# Altium schematic sheet Wide-Band.SchDoc
size A4; SheetNumber: 4; SheetTotal: 5
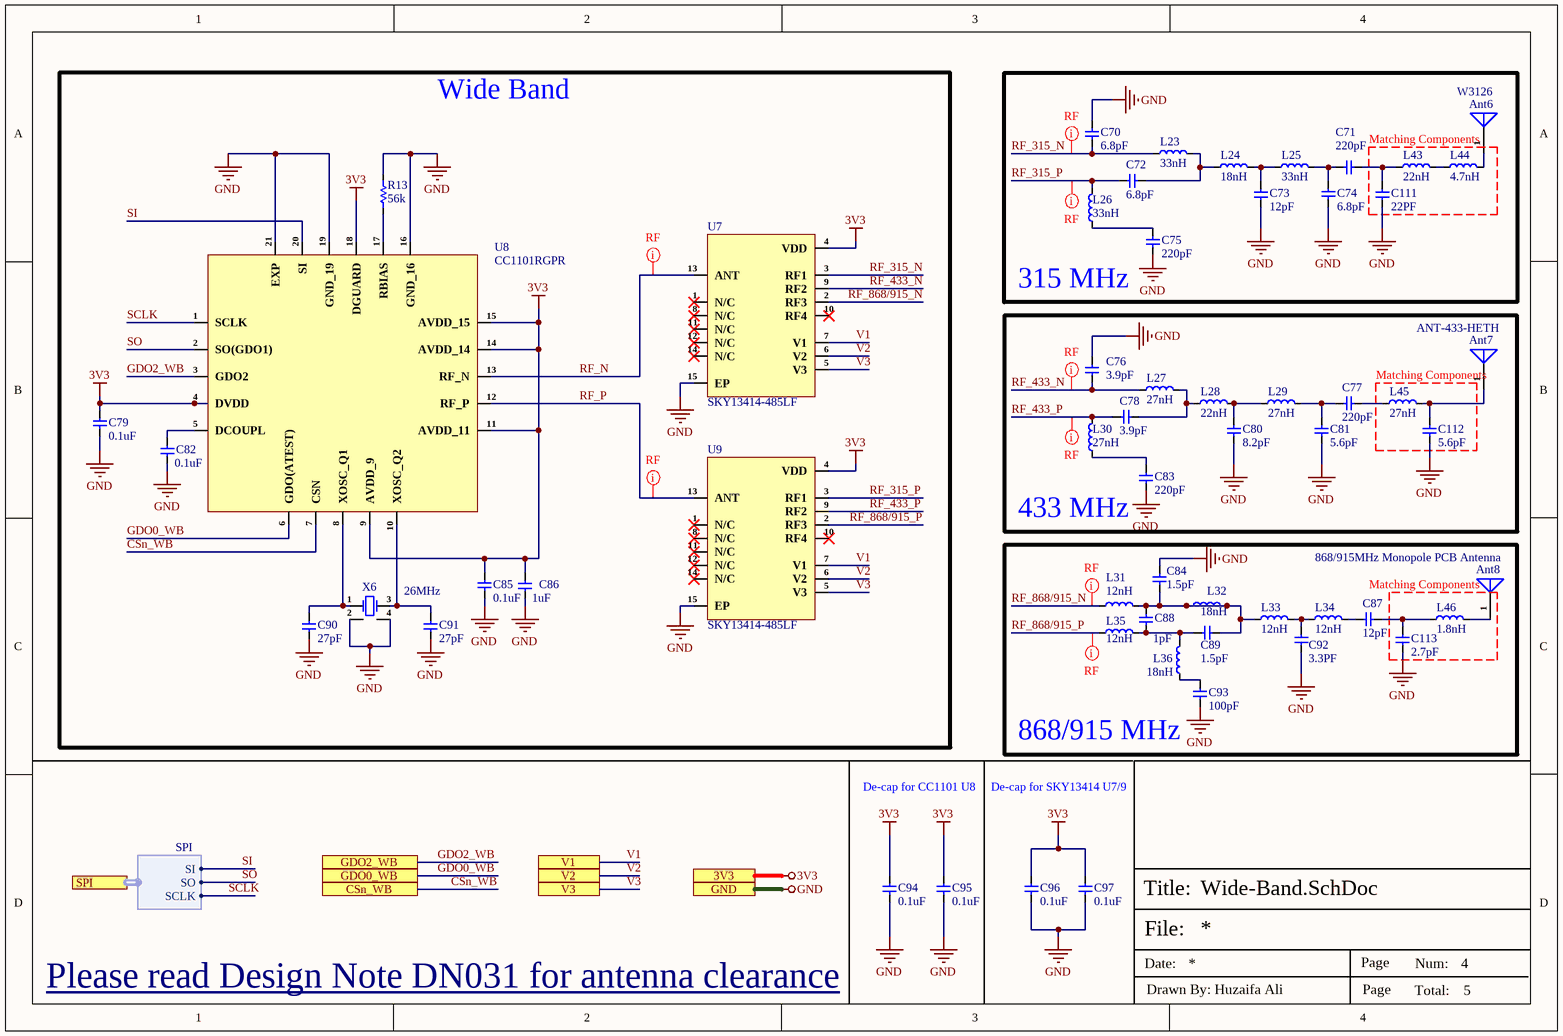
[diagram p0: Wide-Band.SchDoc]

## Parts
Ant6  W3126  [W3126]
Ant7  ANT-433-HETH  [ANT-433-HETH]
Ant8  868/915MHz Monopole PCB Antenna  [868/915MHz Monopole PCB Antenna]
C70  6.8pF  [Cap-0402]
C71  220pF  [Cap-0402]
C72  6.8pF  [Cap-0402]
C73  12pF  [Cap-0402]
C74  6.8pF  [Cap-0402]
C75  220pF  [Cap-0402]
C76  3.9pF  [Cap-0402]
C77  220pF  [Cap-0402]
C78  3.9pF  [Cap-0402]
C79  0.1uF  [Cap-0402]
C80  8.2pF  [Cap-0402]
C81  5.6pF  [Cap-0402]
C82  0.1uF  [Cap-0402]
C83  220pF  [Cap-0402]
C84  1.5pF  [Cap-0402]
C85  0.1uF  [Cap-0402]
C86  1uF  [Cap-0402]
C87  12pF  [Cap-0402]
C88  1pF  [Cap-0402]
C89  1.5pF  [Cap-0402]
C90  27pF  [Cap-0402]
C91  27pF  [Cap-0402]
C92  3.3PF  [Cap-0402]
C93  100pF  [Cap-0402]
C94  0.1uF  [Cap-0402]
C95  0.1uF  [Cap-0402]
C96  0.1uF  [Cap-0402]
C97  0.1uF  [Cap-0402]
C111  22PF  [Cap-0402]
C112  5.6pF  [Cap-0402]
C113  2.7pF  [CAP-0201]
L23  33nH  [IND-0402]
L24  18nH  [IND-0402]
L25  33nH  [IND-0402]
L26  33nH  [IND-0402]
L27  27nH  [IND-0402]
L28  22nH  [IND-0402]
L29  27nH  [IND-0402]
L30  27nH  [IND-0402]
L31  12nH  [IND-0402]
L32  18nH  [IND-0402]
L33  12nH  [IND-0402]
L34  12nH  [IND-0402]
L35  12nH  [IND-0402]
L36  18nH  [IND-0402]
L43  22nH  [IND-0402]
L44  4.7nH  [IND-0402]
L45  27nH  [IND-0402]
L46  1.8nH  [IND-0402]
R13  56k  [Res-0402]
U7  SKY13414-485LF  [14-QFN (2x2)]
U8  CC1101RGPR  [20-QFN (4x4)]
U9  SKY13414-485LF  [14-QFN (2x2)]
X6  26MHz  [NX3225GA-26MHZ-EXS00A-CG01972]

## Blocks framed on the sheet
Wide Band: C79 C82 C85 C86 C90 C91 R13 U7-U9 X6
315 MHz: Ant6 C70-C75 L23-L26
Matching Components: C111 L43 L44
433 MHz: Ant7 C76-C78 C80 C81 C83 L27-L30
Matching Components: C112 L45
868/915 MHz: Ant8 C84 C87-C89 C92 C93 C113 L31-L36 L46

## Ports
3V3 (see Top-Sheet[3B], CC1101[2D], Controller-Sheet[2D], Power-Sheet[1D]), CSn_WB (see Top-Sheet[3B], Controller-Sheet[2D]), GDO0_WB (see Top-Sheet[3B], Controller-Sheet[2D]), GDO2_WB (see Top-Sheet[3B], Controller-Sheet[2D]), GND (see Top-Sheet[3B], CC1101[2D], Controller-Sheet[2D], Power-Sheet[1D]), SPI (harness SPI, see Top-Sheet[3B], CC1101[2D], Controller-Sheet[3D]), V1 (see Top-Sheet[3B], Controller-Sheet[2D]), V2 (see Top-Sheet[3B], Controller-Sheet[2D]), V3 (see Top-Sheet[3B], Controller-Sheet[2D])

## Harnesses
SPI: SI, SO, SCLK

## Nets
3V3: C79.1 C85.1 C86.2 C94.1 C95.1 C96.1 C97.1 U7.4(VDD) U8.4(DVDD) U8.9(AVDD_9) U8.11(AVDD_11) U8.14(AVDD_14) U8.15(AVDD_15) U8.18(DGUARD) U9.4(VDD) ; port 3V3
GND: C70.2 C73.1 C74.2 C75.1 C76.2 C79.2 C80.1 C81.1 C82.1 C83.1 C84.2 C85.2 C86.1 C90.1 C91.1 C92.1 C93.1 C94.2 C95.2 C96.2 C97.2 C111.1 C112.1 C113.1 R13.2 U7.15(EP) U8.16(GND_16) U8.19(GND_19) U8.21(EXP) U9.15(EP) X6.2(GND) X6.4(GND) ; port GND
CSn_WB: U8.7(CSN) ; port CSn_WB
GDO0_WB: U8.6(GDO(ATEST)) ; port GDO0_WB
GDO2_WB: U8.3(GDO2) ; port GDO2_WB
RF_315_N: C70.1 L23.1 U7.3(RF1)
RF_315_P: C72.1 L26.2 U9.3(RF1)
RF_433_N: C76.1 L27.1 U7.9(RF2)
RF_433_P: C78.2 L30.2 U9.9(RF2)
RF_868/915_N: L31.1 U7.2(RF3)
RF_868/915_P: L35.1 U9.2(RF3)
RF_N: U7.13(ANT) U8.13(RF_N)
RF_P: U8.12(RF_P) U9.13(ANT)
SCLK: U8.1(SCLK) ; port SPI.SCLK
SI: U8.20(SI) ; port SPI.SI
SO: U8.2(SO(GDO1)) ; port SPI.SO
V1: U7.7(V1) U9.7(V1) ; port V1
V2: U7.6(V2) U9.6(V2) ; port V2
V3: U7.5(V3) U9.5(V3) ; port V3
NetAnt6_1: Ant6.1(FEED) L44.2
NetAnt7_1: Ant7.1(FEED) C112.2 L45.2
NetAnt8_1: Ant8.1(FEED) L46.2
NetC71_1: C71.1 C111.2 L43.1
NetC71_2: C71.2 C74.1 L25.2
NetC72_2: C72.2 L23.2 L24.1
NetC73_2: C73.2 L24.2 L25.1
NetC75_2: C75.2 L26.1
NetC77_1: C77.1 L45.1
NetC77_2: C77.2 C81.2 L29.2
NetC78_1: C78.1 L27.2 L28.1
NetC80_2: C80.2 L28.2 L29.1
NetC82_2: C82.2 U8.5(DCOUPL)
NetC83_2: C83.2 L30.1
NetC84_1: C84.1 C88.2 C89.1 L31.2 L32.1 L32.2 L33.1
NetC87_1: C87.1 L34.2
NetC87_2: C87.2 C113.2 L46.1
NetC88_1: C88.1 C89.2 L35.2 L36.2
NetC90_2: C90.2 U8.8(XOSC_Q1) X6.1(OSC1)
NetC91_2: C91.2 U8.10(XOSC_Q2) X6.3(OSC2)
NetC92_2: C92.2 L33.2 L34.1
NetC93_2: C93.2 L36.1
NetL43_2: L43.2 L44.1
NetR13_1: R13.1 U8.17(RBIAS)

Not connected (* = marked no-connect by the designer): U7 1(N/C)* 8(N/C)* 10(RF4)* 11(N/C)* 12(N/C)* 14(N/C)*; U9 1(N/C)* 8(N/C)* 10(RF4)* 11(N/C)* 12(N/C)* 14(N/C)*

## Layout directives
net class RF: RF_315_N, RF_315_P, RF_433_N, RF_433_P, RF_868/915_N, RF_868/915_P, RF_N, RF_P

## Notes on the sheet
- (near Ant8) Matching Components
- De-cap for CC1101 U8
- De-cap for SKY13414 U7/9
- Please read Design Note DN031 for antenna clearance <https://www.ti.com/lit/an/swra328/swra328.pdf?ts=1705904691680>
- File:
- Title:
- Date:
- Page
- Num:
- Total:
- Drawn By: Huzaifa Ali

## Library data of the parts
Ant6 = W3126: RF ANT 315MHZ HELICAL SOLDER SMD; Manufacturer: Pulse; Impedance: 50R; Number of Bands: 1; Return Loss: -10dB; Gain: -5dB; VSWR: 1.9; Item Type: Antenna; Supplier: Mouser; Supplier Part Number: 673-W3126; Manufacturer Part Number: W3126; RoHS: Yes; Category: RF Antennas; Stock: 256; Pricing: 1=1.73, 10=1.55, 50=1.55, 100=1.25, 1000=0.852, 10000=0.735 (USD); Mounting Technology: Surface Mount,Through Hole,PCB; Packaging: Tray; Series: -; Package Quantity: 1600; Termination: Solder; Frequency: 315MHz; Height: 0.276inch; Radiation Hardening: No; ComponentLink1URL: https://datasheet.ciiva.com/8153/+w3126-8153071.pdf?src-supplier=Avnet; ComponentLink1Description: https://datasheet.ciiva.com/8153/+w3126-8153071.pdf?src-supplier=Avnet; ComponentLink2URL: https://datasheet.ciiva.com/2792/+w3126-2792620.pdf?src-supplier=Digikey; ComponentLink2Description: https://datasheet.ciiva.com/2792/+w3126-2792620.pdf?src-supplier=Digikey
Ant7 = ANT-433-HETH: RF ANT 433MHZ HELICAL SLD TH; Manufacturer: TE Connectivity; Item Type: Antenna; Manufacturer Part Number: ANT-433-HETH; Package: Custom
Ant8 = 868/915MHz Monopole PCB Antenna: Monopole PCB Antenna with Single or Dual Band Option; Manufacturer Part Number: 868/915MHz Monopole PCB Antenna; Item Type: Antenna; ComponentLink1Description: Anttena; ComponentLink1URL: https://www.ti.com/lit/an/swra227e/swra227e.pdf?ts=1705864571951
C70 C72 C74 = CC0402CRNPO9BN6R8: CAP CER 6.8PF 50V C0G/NPO 0402; Manufacturer: Yageo; Dielectric: C0G; Tolerance: 2%; Insulation Resistance: 10GR; Item Type: Capacitor; Supplier: Future Electronics; Supplier Part Number: 3247368; Manufacturer Part Number: CC0402CRNPO9BN6R8; RoHS: Yes; Category: Ceramic Capacitors; Stock: 200000; Pricing: 10000=0.0024, 40000=0.0022, 150000=0.0021, 400000=0.002, 1000000=0.0019 (USD); Mounting Technology: Surface Mount; Case/Package: 0402; Case Code (Imperial): 0402; Case Code (Metric): 1005; Weight: 2.3E-05oz; Min Operating Temperature: -55°C; Max Operating Temperature: 125°C; Value: 6.8pF; Packaging: Tape and Reel; Voltage Rating: 50V; Voltage Rating (DC): 50V; Termination: SMD/SMT; Series: CC; Construction: Flat; Length: 1mm; Width: 0.5mm; Height: 0.5mm; Depth: 0.5mm; Radiation Hardening: No; RoHS Compliant: Yes; ComponentLink1URL: https://datasheet.ciiva.com/11587/upy-gp-np0-16v-to-50v-8-11587182.pdf?src-supplier=Avnet; ComponentLink1Description: https://datasheet.ciiva.com/11587/upy-gp-np0-16v-to-50v-8-11587182.pdf?src-supplier=Avnet; LCSC Part Number: C189470
C71 C75 C77 C83 = CC0402JRNPO9BN221: CAP CER 220PF 50V C0G/NPO 0402; Manufacturer: Yageo; Dielectric Material: Ceramic; Tolerance: 10%; Dielectric: C0G; Temperature Coefficient: 30ppm/°C; Insulation Resistance: 10GR; Dissipation Factor: 0.1%; Supplier 1: RSComponents; Manufacturer Part Number: CC0402JRNPO9BN221; RoHS: Yes; Category: Ceramic Capacitors; Stock 1: 20000; Pricing 1: 10000=0.00600, 100000=0.00600 (GBP); Mount: Surface Mount; Case/Package: 0402; Number of Pins: 2; Case Code (Metric): 1005; Case Code (Imperial): 0402; Min Operating Temperature: -55°C; Max Operating Temperature: 125°C; Capacitance: 220pF; Package Quantity: 1; Voltage Rating: 50V; Packaging: Tape and Reel; Termination: SMD/SMT; Voltage: 50V; Series: CC; Length: 1mm; Width: 0.02inch; Height: 0.5mm; Thickness: 0.022inch; Depth: 0.5mm; Radiation Hardening: No; RoHS Compliant: Yes; REACH SVHC: No SVHC; Lead Free: Lead Free; ComponentLink1URL: https://datasheet.ciiva.com/11786/0900766b8079c870-11786154.pdf?src-supplier=RSComponents; ComponentLink1Description: https://datasheet.ciiva.com/11786/0900766b8079c870-11786154.pdf?src-supplier=RSComponents; ComponentLink2URL: https://datasheet.ciiva.com/7656/1132289-7656616.pdf?src-supplier=Element14; ComponentLink2Description: https://datasheet.ciiva.com/7656/1132289-7656616.pdf?src-supplier=Element14; ComponentLink3URL: https://datasheet.ciiva.com/8033/1443161-8033609.pdf?src-supplier=Element14; ComponentLink3Description: https://datasheet.ciiva.com/8033/1443161-8033609.pdf?src-supplier=Element14; ComponentLink4URL: https://datasheet.ciiva.com/8033/1443161-8033608.pdf?src-supplier=Element14; ComponentLink4Description: https://datasheet.ciiva.com/8033/1443161-8033608.pdf?src-supplier=Element14; ComponentLink5URL: https://datasheet.ciiva.com/176/mlccorderingcode-176384.pdf?src-supplier=Digi-Key; ComponentLink5Description: https://datasheet.ciiva.com/176/mlccorderingcode-176384.pdf?src-supplier=Digi-Key; ComponentLink6URL: https://datasheet.ciiva.com/176/mlccorderingcode-176383.pdf?src-supplier=Digi-Key; ComponentLink6Description: https://datasheet.ciiva.com/176/mlccorderingcode-176383.pdf?src-supplier=Digi-Key; ComponentLink7URL: https://datasheet.ciiva.com/176/mlccorderingcode-176385.pdf?src-supplier=Digi-Key; ComponentLink7Description: https://datasheet.ciiva.com/176/mlccorderingcode-176385.pdf?src-supplier=Digi-Key; ComponentLink8URL: https://datasheet.ciiva.com/17434/upy-gp-np0-16v-to-50v-8-17434343.pdf?src-supplier=Avnet+Europe; ComponentLink8Description: https://datasheet.ciiva.com/17434/upy-gp-np0-16v-to-50v-8-17434343.pdf?src-supplier=Avnet+Europe; Supplier Part Number 1: 6169284; LCSC Part Number: C107001
C73 C87 = GJM1555C1H120GB01D: CAP CER 12PF 50V C0G/NP0 0402; Manufacturer: Murata; Tolerance: 2%; Dielectric: C0G; Supplier 1: Digi-Key; Manufacturer Part Number: GJM1555C1H120GB01D; RoHS: Yes; Category: Ceramic Capacitors; Stock 1: 266975; Pricing 1: 1=0.18000, 10=0.12600, 50=0.07560, 100=0.06390, 500=0.04370, 1000=0.03865, 2500=0.03698, 5000=0.03361 (USD); Mount: Surface Mount; Case/Package: 0402; Case Code (Imperial): 0402; Case Code (Metric): 1005; Min Operating Temperature: -55°C; Max Operating Temperature: 125°C; Capacitance: 12pF; Voltage Rating: 50V; Voltage Rating (DC): 50V; Packaging: Tape and Reel; Package Quantity: 10000; Termination: SMD/SMT; Series: GJM; Construction: Flat; Length: 1mm; Width: 0.5mm; Height: 0.5mm; Thickness: 0.022inch; Depth: 0.5mm; Radiation Hardening: No; Lead Free: Lead Free; RoHS Compliant: Yes; ComponentLink1URL: https://datasheet.ciiva.com/11608/product-11608208.pdf?src-supplier=Avnet; ComponentLink1Description: https://datasheet.ciiva.com/11608/product-11608208.pdf?src-supplier=Avnet; ComponentLink2URL: https://datasheet.ciiva.com/29542/partnumbering-e-01-29542716.pdf?src-supplier=Digi-Key; ComponentLink2Description: https://datasheet.ciiva.com/29542/partnumbering-e-01-29542716.pdf?src-supplier=Digi-Key; ComponentLink3URL: https://datasheet.ciiva.com/29542/partnumbering-e-01-29542715.pdf?src-supplier=Digi-Key; ComponentLink3Description: https://datasheet.ciiva.com/29542/partnumbering-e-01-29542715.pdf?src-supplier=Digi-Key; ComponentLink4URL: https://datasheet.ciiva.com/29542/partnumbering-e-01-29542717.pdf?src-supplier=Digi-Key; ComponentLink4Description: https://datasheet.ciiva.com/29542/partnumbering-e-01-29542717.pdf?src-supplier=Digi-Key; Supplier Part Number 1: 490-8078-1-ND; LCSC Part Number: C161305
C76 C78 = CC0402BRNPO9BN3R9: CAP CER 3.9PF 50V C0G/NPO 0402; Manufacturer: Yageo; Item Type: Capacitor; Supplier: Future Electronics; Supplier Part Number: 4917324; Manufacturer Part Number: CC0402BRNPO9BN3R9; RoHS: Yes; Category: Ceramic Capacitors; Stock: 280000; Pricing: 10000=0.0034, 40000=0.0032, 150000=0.0031, 250000=0.003, 500000=0.0028 (USD); ComponentLink1URL: https://datasheet.ciiva.com/11587/upy-gp-np0-16v-to-50v-8-11587133.pdf?src-supplier=Avnet; ComponentLink1Description: https://datasheet.ciiva.com/11587/upy-gp-np0-16v-to-50v-8-11587133.pdf?src-supplier=Avnet; ComponentLink2URL: https://datasheet.ciiva.com/13211/upy-gp-np0-16v-to-50v-8-13211126.pdf?src-supplier=Mouser; ComponentLink2Description: https://datasheet.ciiva.com/13211/upy-gp-np0-16v-to-50v-8-13211126.pdf?src-supplier=Mouser; LCSC Part Number: C505474
C79 C85 C94-C97 = C1005X5R1H104K050BB: CAP CER 0.1UF 50V X5R 0402; Manufacturer: TDK; Dielectric Material: Ceramic; Capacitance: 100nF; Tolerance: 10%; Supplier 1: Digi-Key; Manufacturer Part Number: C1005X5R1H104K050BB; Stock 1: 1455182; Pricing 1: 1=0.12, 10=0.09, 50=0.049, 100=0.04, 500=0.02858, 1000=0.02245, 2500=0.02041, 5000=0.01878 (USD); Mount: Surface Mount; Case/Package: 0402; Case Code (Metric): 1005; Case Code (Imperial): 0402; Weight: 2.3E-05oz; Min Operating Temperature: -55°C; Max Operating Temperature: 85°C; Dielectric: X5R; Voltage Rating: 50V; Packaging: Tape and Reel; Voltage Rating (DC): 50V; Termination: SMD/SMT; Construction: Flat; Package Quantity: 1; Resistor Type: Ceramic; Voltage: 50V; Series: C; Length: 1mm; Width: 0.02inch; Height: 0.5mm; Depth: 0.5mm; Thickness: 0.022inch; Radiation Hardening: No; Lead Free: Lead Free; REACH SVHC: No SVHC; RoHS Compliant: Yes; ComponentLink1URL: https://product.tdk.com/info/en/catalog/spec/mlccspec_commercial_general_midvoltage_en.pdf?src-supplier=Digi-Key; ComponentLink1Description: https://product.tdk.com/info/en/catalog/spec/mlccspec_commercial_general_midvoltage_en.pdf?src-supplier=Digi-Key; ComponentLink2URL: http://www.tdk.co.jp/tefe02/e413_c.pdf?src-supplier=Future+Electronics; ComponentLink2Description: http://www.tdk.co.jp/tefe02/e413_c.pdf?src-supplier=Future+Electronics; ComponentLink3URL: https://www.verical.com/server-webapp/html/getDatasheet?partID=743571&src-supplier=Verical; ComponentLink3Description: https://www.verical.com/server-webapp/html/getDatasheet?partID=743571&src-supplier=Verical; ComponentLink4URL: http://www.tdk.co.jp/tefe02/e412_c.pdf?src-supplier=Avnet+Europe; ComponentLink4Description: http://www.tdk.co.jp/tefe02/e412_c.pdf?src-supplier=Avnet+Europe; Supplier Part Number 1: 445-5942-1-ND; LCSC Part Number: C2181865
C80 = CC0402DRNPO9BN8R2: CAP CER 8.2PF 50V C0G/NPO 0402; Manufacturer: Yageo; Item Type: Capacitor; Supplier: Future Electronics; Supplier Part Number: 2138063; Manufacturer Part Number: CC0402DRNPO9BN8R2; RoHS: Yes; Category: Ceramic Capacitors; Stock: 120000; Pricing: 10000=0.0024, 40000=0.0022, 150000=0.0021, 400000=0.002, 1000000=0.0019 (USD); ComponentLink1URL: https://datasheet.ciiva.com/144/mlccorderingcode-144589.pdf?src-supplier=Digikey; ComponentLink1Description: https://datasheet.ciiva.com/144/mlccorderingcode-144589.pdf?src-supplier=Digikey; ComponentLink2URL: https://datasheet.ciiva.com/144/mlccorderingcode-144590.pdf?src-supplier=Digikey; ComponentLink2Description: https://datasheet.ciiva.com/144/mlccorderingcode-144590.pdf?src-supplier=Digikey; ComponentLink3URL: https://datasheet.ciiva.com/144/mlccorderingcode-144591.pdf?src-supplier=Digikey; ComponentLink3Description: https://datasheet.ciiva.com/144/mlccorderingcode-144591.pdf?src-supplier=Digikey; ComponentLink4URL: https://datasheet.ciiva.com/13208/upy-gp-np0-16v-to-50v-8-13208987.pdf?src-supplier=Mouser; ComponentLink4Description: https://datasheet.ciiva.com/13208/upy-gp-np0-16v-to-50v-8-13208987.pdf?src-supplier=Mouser; ComponentLink5URL: https://datasheet.ciiva.com/11587/upy-gp-np0-16v-to-50v-8-11587051.pdf?src-supplier=Avnet; ComponentLink5Description: https://datasheet.ciiva.com/11587/upy-gp-np0-16v-to-50v-8-11587051.pdf?src-supplier=Avnet; LCSC Part Number: C327412
C81 C112 = CC0402BRNPO9BN5R6: CAP CER 5.6PF 50V C0G/NPO 0402; Manufacturer: Yageo; Item Type: Capacitor; Supplier: Future Electronics; Supplier Part Number: 3807997; Manufacturer Part Number: CC0402BRNPO9BN5R6; RoHS: Yes; Category: Ceramic Capacitors; Stock: 1840000; Pricing: 10000=0.0035, 40000=0.0031, 50000=0.0033, 150000=0.003, 250000=0.0031, 300000=0.0029, 500000=0.003, 750000=0.0027, 1500000=0.0028 (USD); Halogen Free: 5694HalogenFree; ComponentLink1URL: https://datasheet.ciiva.com/26829/getdatasheetpartid-403430-26829253.pdf?src-supplier=Verical; ComponentLink1Description: https://datasheet.ciiva.com/26829/getdatasheetpartid-403430-26829253.pdf?src-supplier=Verical; ComponentLink2URL: https://datasheet.ciiva.com/13265/upy-gp-np0-16v-to-50v-8-3714-13265516.pdf?src-supplier=Mouser; ComponentLink2Description: https://datasheet.ciiva.com/13265/upy-gp-np0-16v-to-50v-8-3714-13265516.pdf?src-supplier=Mouser; LCSC Part Number: C505468
C82 = C1005X5R1H104K050BB: CAP CER 0.1UF 50V X5R 0402; Manufacturer: TDK; Dielectric Material: Ceramic; Capacitance: 100nF; Tolerance: 10%; Item Type: Capacitor; Supplier 1: Digi-Key; Manufacturer Part Number: C1005X5R1H104K050BB; Stock 1: 1455182; Pricing 1: 1=0.12, 10=0.09, 50=0.049, 100=0.04, 500=0.02858, 1000=0.02245, 2500=0.02041, 5000=0.01878 (USD); Mount: Surface Mount; Case/Package: 0402; Case Code (Metric): 1005; Case Code (Imperial): 0402; Weight: 2.3E-05oz; Min Operating Temperature: -55°C; Max Operating Temperature: 85°C; Dielectric: X5R; Voltage Rating: 50V; Packaging: Tape and Reel; Voltage Rating (DC): 50V; Termination: SMD/SMT; Construction: Flat; Package Quantity: 1; Resistor Type: Ceramic; Voltage: 50V; Series: C; Length: 1mm; Width: 0.02inch; Height: 0.5mm; Depth: 0.5mm; Thickness: 0.022inch; Radiation Hardening: No; Lead Free: Lead Free; REACH SVHC: No SVHC; RoHS Compliant: Yes; ComponentLink1URL: https://product.tdk.com/info/en/catalog/spec/mlccspec_commercial_general_midvoltage_en.pdf?src-supplier=Digi-Key; ComponentLink1Description: https://product.tdk.com/info/en/catalog/spec/mlccspec_commercial_general_midvoltage_en.pdf?src-supplier=Digi-Key; ComponentLink2URL: http://www.tdk.co.jp/tefe02/e413_c.pdf?src-supplier=Future+Electronics; ComponentLink2Description: http://www.tdk.co.jp/tefe02/e413_c.pdf?src-supplier=Future+Electronics; ComponentLink3URL: https://www.verical.com/server-webapp/html/getDatasheet?partID=743571&src-supplier=Verical; ComponentLink3Description: https://www.verical.com/server-webapp/html/getDatasheet?partID=743571&src-supplier=Verical; ComponentLink4URL: http://www.tdk.co.jp/tefe02/e412_c.pdf?src-supplier=Avnet+Europe; ComponentLink4Description: http://www.tdk.co.jp/tefe02/e412_c.pdf?src-supplier=Avnet+Europe; Supplier Part Number 1: 445-5942-1-ND; LCSC Part Number: C2181865
C84 C89 = CC0402BRNPO9BN1R5: CAP CER 1.5PF 50V C0G/NPO 0402; Manufacturer: Yageo; Temperature Coefficient: 30ppm/°C; Item Type: Capacitor; Supplier: Future Electronics; Supplier Part Number: 6564710; Manufacturer Part Number: CC0402BRNPO9BN1R5; RoHS: Yes; Category: Ceramic Capacitors; Stock: 530000; Pricing: 10000=0.0033, 40000=0.0031, 150000=0.003, 300000=0.0029, 750000=0.0027 (USD); Halogen Free: 5694HalogenFree; ComponentLink1URL: https://datasheet.ciiva.com/15189/getdatasheetpartid-403423-15189101.pdf?src-supplier=Verical; ComponentLink1Description: https://datasheet.ciiva.com/15189/getdatasheetpartid-403423-15189101.pdf?src-supplier=Verical; ComponentLink2URL: https://datasheet.ciiva.com/11587/upy-gp-np0-16v-to-50v-8-11587119.pdf?src-supplier=Avnet; ComponentLink2Description: https://datasheet.ciiva.com/11587/upy-gp-np0-16v-to-50v-8-11587119.pdf?src-supplier=Avnet; ComponentLink3URL: https://datasheet.ciiva.com/13263/upy-gp-np0-16v-to-50v-8-3714-13263317.pdf?src-supplier=Mouser; ComponentLink3Description: https://datasheet.ciiva.com/13263/upy-gp-np0-16v-to-50v-8-3714-13263317.pdf?src-supplier=Mouser; LCSC Part Number: C282238
C86 = CC0402KRX5R6BB105: CAP CER 1UF 10V X5R 0402; Manufacturer: Yageo; Tolerance: 10%; Dissipation Factor: 15%; Supplier 1: Mouser; Manufacturer Part Number: CC0402KRX5R6BB105; RoHS: Yes; Category: Ceramic Capacitors; Stock 1: 6711367; Pricing 1: 1=0.11000, 10=0.05500, 50=0.05500, 100=0.03300, 500=0.02700, 1000=0.02200, 2500=0.02100, 10000=0.01800 (USD); Mount: Surface Mount; Case/Package: 0402; Number of Pins: 2; Case Code (Metric): 1005; Case Code (Imperial): 0402; Min Operating Temperature: -55°C; Max Operating Temperature: 85°C; Capacitance: 1uF; Dielectric: X5R; Package Quantity: 1; Voltage Rating: 10V; Packaging: Tape and Reel; Voltage Rating (DC): 10V; Termination: SMD/SMT; Resistor Type: Ceramic; Series: CC; Construction: Flat; Length: 1mm; Width: 0.02inch; Height: 0.5mm; Thickness: 0.022inch; Depth: 0.5mm; Radiation Hardening: No; REACH SVHC: No SVHC; Lead Free: Lead Free; Halogen Free: Halogen Free; RoHS Compliant: Yes; ComponentLink1URL: https://datasheet.ciiva.com/176/upy-gphc-x5r-4v-to-50v-12-176704.pdf?src-supplier=Digi-Key; ComponentLink1Description: https://datasheet.ciiva.com/176/upy-gphc-x5r-4v-to-50v-12-176704.pdf?src-supplier=Digi-Key; ComponentLink2URL: https://datasheet.ciiva.com/176/mlccorderingcode-176705.pdf?src-supplier=Digi-Key; ComponentLink2Description: https://datasheet.ciiva.com/176/mlccorderingcode-176705.pdf?src-supplier=Digi-Key; ComponentLink3URL: https://datasheet.ciiva.com/176/mlccorderingcode-176706.pdf?src-supplier=Digi-Key; ComponentLink3Description: https://datasheet.ciiva.com/176/mlccorderingcode-176706.pdf?src-supplier=Digi-Key; Supplier Part Number 1: 603-CC402KRX5R6BB105; LCSC Part Number: C106254
C88 = CC0402BRNPO9BN1R0: CAP CER 1PF 50V C0G/NPO 0402; Manufacturer: Yageo; Temperature Coefficient: 30ppm/°C; Item Type: Capacitor; Supplier: Future Electronics; Supplier Part Number: 7847221; Manufacturer Part Number: CC0402BRNPO9BN1R0; RoHS: Yes; Category: Ceramic Capacitors; Stock: 180000; Pricing: 10000=0.0034, 40000=0.0032, 150000=0.0031, 250000=0.003, 500000=0.0028 (USD); Halogen Free: 5694HalogenFree; ComponentLink1URL: https://datasheet.ciiva.com/26862/getdatasheetpartid-403422-26862565.pdf?src-supplier=Verical; ComponentLink1Description: https://datasheet.ciiva.com/26862/getdatasheetpartid-403422-26862565.pdf?src-supplier=Verical; ComponentLink2URL: https://datasheet.ciiva.com/11587/upy-gp-np0-16v-to-50v-8-11587115.pdf?src-supplier=Avnet; ComponentLink2Description: https://datasheet.ciiva.com/11587/upy-gp-np0-16v-to-50v-8-11587115.pdf?src-supplier=Avnet; LCSC Part Number: C309455
C90 C91 = 0402N270J250CT: CAP CER 27PF 25V C0G/NP0 0402; Manufacturer: Walsin Technologies; Item Type: Capacitor; Supplier 1: Digi-Key; Manufacturer Part Number: 0402N270J250CT; Stock 1: 71180; Pricing 1: 1=0.1, 10=0.017, 50=0.0094, 100=0.0076, 500=0.00544, 1000=0.00427, 2500=0.00388, 5000=0.00357 (USD); RoHS Compliant: Yes; Supplier Part Number 1: 1292-1291-1-ND; LCSC Part Number: C424826; ComponentLink1Description: LCSC; ComponentLink1URL: https://lcsc.com/product-detail/Multilayer-Ceramic-Capacitors-MLCC-SMD-SMT_Walsin-Tech-Corp-0402N270J250CT_C424826.html
C92 = RF15N3R3C500CT: CAP CER 3.3PF 50V C0G/NP0 0402; Manufacturer: Walsin Tech Corp; Item Type: Capacitor; Manufacturer Part Number: RF15N3R3C500CT; Package: 0402; LCSC Part Number: C172822; ComponentLink1Description: LCSC; ComponentLink1URL: https://www.lcsc.com/product-detail/Multilayer-Ceramic-Capacitors-MLCC-SMD-SMT_Walsin-Tech-Corp-RF15N3R3C500CT_C172822.html
C93 = 04025A101JAT2A: CAP CER 100PF 50V C0G/NP0 0402; Manufacturer: Kyocera AVX; Tolerance: 5%; Dielectric: C0G; Insulation Resistance: 1GR; Temperature Coefficient: 30ppm/°C; Dissipation Factor: 2.5%; Item Type: Capacitor; Supplier 1: Avnet; Manufacturer Part Number: 04025A101JAT2A; RoHS: Yes; Category: Ceramic Capacitors; Stock 1: 3437500; Pricing 1: 10000=0.10788, 20000=0.10540, 40000=0.10292, 60000=0.10044, 80000=0.09796, 100000=0.09548, 1000000=0.09424 (USD); Mount: Surface Mount,PCB; Case/Package: 0402; Case Code (Metric): 1005; Case Code (Imperial): 0402; Contact Plating: Tin,Matte; Min Operating Temperature: -55°C; Max Operating Temperature: 125°C; Capacitance: 100pF; Voltage Rating (DC): 50V; Packaging: Tape and Reel; Voltage Rating: 50V; Package Quantity: 10000; Termination: SMD/SMT; Voltage: 50V; Series: -; Construction: Flat; Length: 1mm; Width: 0.004inch; Height: 0.56mm; Thickness: 0.013inch; Depth: 0.5mm; Radiation Hardening: No; Reach SVHC Compliant: Yes; Lead Free: Lead Free; RoHS Compliant: Yes; ComponentLink1URL: https://datasheet.ciiva.com/11786/0900766b80def0e2-11786618.pdf?src-supplier=RSComponents; ComponentLink1Description: https://datasheet.ciiva.com/11786/0900766b80def0e2-11786618.pdf?src-supplier=RSComponents; ComponentLink2URL: https://datasheet.ciiva.com/1123/493359-1123473.pdf?src-supplier=Element14; ComponentLink2Description: https://datasheet.ciiva.com/1123/493359-1123473.pdf?src-supplier=Element14; ComponentLink3URL: https://datasheet.ciiva.com/1123/493359-1123474.pdf?src-supplier=Element14; ComponentLink3Description: https://datasheet.ciiva.com/1123/493359-1123474.pdf?src-supplier=Element14; ComponentLink4URL: https://datasheet.ciiva.com/16332/ccog-16332501.pdf?src-supplier=Future+Electronics; ComponentLink4Description: https://datasheet.ciiva.com/16332/ccog-16332501.pdf?src-supplier=Future+Electronics; ComponentLink5URL: https://datasheet.ciiva.com/46392/759117-46392007.pdf?src-supplier=Element14; ComponentLink5Description: https://datasheet.ciiva.com/46392/759117-46392007.pdf?src-supplier=Element14; ComponentLink6URL: https://datasheet.ciiva.com/150/ccog-150473.pdf?src-supplier=Digi-Key; ComponentLink6Description: https://datasheet.ciiva.com/150/ccog-150473.pdf?src-supplier=Digi-Key; ComponentLink7URL: https://datasheet.ciiva.com/150/ccog-150474.pdf?src-supplier=Digi-Key; ComponentLink7Description: https://datasheet.ciiva.com/150/ccog-150474.pdf?src-supplier=Digi-Key; ComponentLink8URL: https://datasheet.ciiva.com/2987/ccog-2987642.pdf?src-supplier=Avnet; ComponentLink8Description: https://datasheet.ciiva.com/2987/ccog-2987642.pdf?src-supplier=Avnet; ComponentLink9URL: https://datasheet.ciiva.com/150/ccog-150475.pdf?src-supplier=Digi-Key; ComponentLink9Description: https://datasheet.ciiva.com/150/ccog-150475.pdf?src-supplier=Digi-Key; ComponentLink10URL: https://datasheet.ciiva.com/8083/ccog-8083054.pdf?src-supplier=Avnet; ComponentLink10Description: https://datasheet.ciiva.com/8083/ccog-8083054.pdf?src-supplier=Avnet; ComponentLink11URL: https://datasheet.ciiva.com/5413/ccog-5413647.pdf?src-supplier=Mouser; ComponentLink11Description: https://datasheet.ciiva.com/5413/ccog-5413647.pdf?src-supplier=Mouser; Supplier Part Number 1: 04025A101JAT2A; LCSC Part Number: C597014
C111 = CC0402JRNPO9BN220: CAP CER 22PF 50V C0G/NPO 0402; Manufacturer: Yageo; Dielectric Material: Ceramic; Tolerance: 5%; Dielectric: C0G; Temperature Coefficient: 30ppm/°C; Insulation Resistance: 100GR; Item Type: Capacitor; Supplier 1: Future Electronics; Manufacturer Part Number: CC0402JRNPO9BN220; RoHS: Yes; Category: Ceramic Capacitors; Stock 1: 200000; Pricing 1: 10000=0.00220, 40000=0.00210, 150000=0.00200, 400000=0.00190, 1000000=0.00180 (USD); Mounting Technology: Surface Mount; Case/Package: 0402; Pins: 2; Case Code (Metric): 1005; Case Code (Imperial): 0402; Min Operating Temperature: -55°C; Max Operating Temperature: 125°C; Value: 22pF; Voltage Rating: 50V; Packaging: Tape and Reel; Package Quantity: 1; Voltage Rating (DC): 50V; Termination: SMD/SMT; Resistor Type: Ceramic; Voltage: 50V; Series: CC; Length: 1mm; Width: 0.02inch; Height: 0.5mm; Thickness: 0.022inch; Depth: 0.5mm; Radiation Hardening: No; Reach SVHC Compliant: Yes; Lead Free: Lead Free; RoHS Compliant: Yes; ComponentLink1URL: https://datasheet.ciiva.com/5789/1443161-5789509.pdf?src-supplier=Farnell; ComponentLink1Description: https://datasheet.ciiva.com/5789/1443161-5789509.pdf?src-supplier=Farnell; ComponentLink2URL: https://datasheet.ciiva.com/8033/1443161-8033606.pdf?src-supplier=Element14; ComponentLink2Description: https://datasheet.ciiva.com/8033/1443161-8033606.pdf?src-supplier=Element14; ComponentLink3URL: https://datasheet.ciiva.com/7656/1132289-7656615.pdf?src-supplier=Element14; ComponentLink3Description: https://datasheet.ciiva.com/7656/1132289-7656615.pdf?src-supplier=Element14; ComponentLink4URL: https://datasheet.ciiva.com/8033/1443161-8033607.pdf?src-supplier=Element14; ComponentLink4Description: https://datasheet.ciiva.com/8033/1443161-8033607.pdf?src-supplier=Element14; ComponentLink5URL: https://datasheet.ciiva.com/8033/1443161-8033605.pdf?src-supplier=Element14; ComponentLink5Description: https://datasheet.ciiva.com/8033/1443161-8033605.pdf?src-supplier=Element14; ComponentLink6URL: https://datasheet.ciiva.com/143/mlccorderingcode-143987.pdf?src-supplier=Digi-Key; ComponentLink6Description: https://datasheet.ciiva.com/143/mlccorderingcode-143987.pdf?src-supplier=Digi-Key; ComponentLink7URL: https://datasheet.ciiva.com/143/mlccorderingcode-143986.pdf?src-supplier=Digi-Key; ComponentLink7Description: https://datasheet.ciiva.com/143/mlccorderingcode-143986.pdf?src-supplier=Digi-Key; ComponentLink8URL: https://datasheet.ciiva.com/143/mlccorderingcode-143988.pdf?src-supplier=Digi-Key; ComponentLink8Description: https://datasheet.ciiva.com/143/mlccorderingcode-143988.pdf?src-supplier=Digi-Key; ComponentLink9URL: https://datasheet.ciiva.com/5425/upy-gp-np0-16v-to-50v-8-5425483.pdf?src-supplier=Mouser; ComponentLink9Description: https://datasheet.ciiva.com/5425/upy-gp-np0-16v-to-50v-8-5425483.pdf?src-supplier=Mouser; ComponentLink10URL: https://datasheet.ciiva.com/15189/getdatasheetpartid-370074-15189117.pdf?src-supplier=Verical; ComponentLink10Description: https://datasheet.ciiva.com/15189/getdatasheetpartid-370074-15189117.pdf?src-supplier=Verical; Supplier Part Number 1: 9105957; LCSC Part Number: C106203
C113 = CC0201CRNPO9BN2R7: CAP CER 2.7PF 50V C0G/NPO 0201; Manufacturer: Yageo; Dielectric: C0G; Item Type: Capacitor; Supplier: Avnet; Supplier Part Number: CC0201CRNPO9BN2R7; Manufacturer Part Number: CC0201CRNPO9BN2R7; RoHS: Yes; Category: Ceramic Capacitors; Stock: 15000; Pricing: 15000=0.0017 (USD); Mounting Technology: Surface Mount; Case/Package: 0201; Case Code (Imperial): 0201; Case Code (Metric): 0603; Weight: 6E-06oz; Min Operating Temperature: -55°C; Max Operating Temperature: 125°C; Value: 2.7pF; Packaging: Tape and Reel; Voltage Rating (DC): 50V; Voltage Rating: 50V; Termination: SMD/SMT; Series: CC; Length: 0.024inch; Width: 0.012inch; Thickness: 0.013inch; RoHS Compliant: Yes; ComponentLink1URL: https://datasheet.ciiva.com/13208/upy-gp-np0-16v-to-50v-8-13208314.pdf?src-supplier=Mouser; ComponentLink1Description: https://datasheet.ciiva.com/13208/upy-gp-np0-16v-to-50v-8-13208314.pdf?src-supplier=Mouser; LCSC Part Number: C325439
L23 L25 L26 = LQG15HN33NH02D: 300mA 33nH ±3% 670mΩ 0402 Inductors (SMD) ROHS; Manufacturer: Murata Electronics; Manufacturer Part Number: LQG15HN33NH02D; Package: 0402; LCSC Part Number: C2044267; Item Type: Inductor; ComponentLink1Description: LCSC; ComponentLink1URL: https://www.lcsc.com/product-detail/Inductors-SMD_Murata-Electronics-LQG15HN33NH02D_C2044267.html
L24 L32 L36 = LQG15HS18NJ02D: FIXED IND 18NH 400MA 360MOHM SMD; Manufacturer: Murata; Core Material: Air; Tolerance: 5%; Self Resonant Frequency: 2.2GHz; Q Factor: 8; Current Rating: 300mA; Shielding: Unshielded; DC Resistance (DCR): 360mR; Test Frequency: 100MHz; Item Type: Inductor; Supplier: Rs; Supplier Part Number: 7254910P; Manufacturer Part Number: LQG15HS18NJ02D; RoHS: Yes; Category: Fixed Inductors; Stock: 4990; Pricing: 100=0.065, 250=0.058, 500=0.049, 1000=0.042 (GBP); Mounting Technology: Surface Mount; Case/Package: 0402; Case Code (Metric): 1005; Case Code (Imperial): 0402; Weight: 2.3E-05oz; Min Operating Temperature: -55°C; Max Operating Temperature: 125°C; Packaging: Tape and Reel; Package Quantity: 1; Inductance Tolerance: 5%; Value: 18nH; Max DC Current: 300mA; Termination: SMD/SMT; DC Current: 300mA; Series: LQG15HS; Max Current Rating: 300mA; Length: 0.039inch; Width: 0.02inch; Height: 0.5mm; Height - Seated (Max): 0.022inch; Depth: 0.55mm; Reach SVHC Compliant: No; Military Standard: Not; Lead Free: Lead Free; RoHS Compliant: Yes; ComponentLink1URL: https://datasheet.ciiva.com/11801/0900766b80f10809-11801396.pdf?src-supplier=Rs; ComponentLink1Description: https://datasheet.ciiva.com/11801/0900766b80f10809-11801396.pdf?src-supplier=Rs; ComponentLink2URL: https://datasheet.ciiva.com/1038/l0075s0083lqg15hs-1038125.pdf?src-supplier=Digikey; ComponentLink2Description: https://datasheet.ciiva.com/1038/l0075s0083lqg15hs-1038125.pdf?src-supplier=Digikey; ComponentLink3URL: https://datasheet.ciiva.com/1038/l0075s0083lqg15hs-1038124.pdf?src-supplier=Digikey; ComponentLink3Description: https://datasheet.ciiva.com/1038/l0075s0083lqg15hs-1038124.pdf?src-supplier=Digikey; ComponentLink4URL: https://datasheet.ciiva.com/1038/l0075s0083lqg15hs-1038126.pdf?src-supplier=Digikey; ComponentLink4Description: https://datasheet.ciiva.com/1038/l0075s0083lqg15hs-1038126.pdf?src-supplier=Digikey; ComponentLink5URL: https://datasheet.ciiva.com/8510/l0075s0083lqg15hs-8510821.pdf?src-supplier=Avnet; ComponentLink5Description: https://datasheet.ciiva.com/8510/l0075s0083lqg15hs-8510821.pdf?src-supplier=Avnet; ComponentLink6URL: https://datasheet.ciiva.com/16444/l0075s0083lqg15hs-16444389.pdf?src-supplier=Future+Electronics; ComponentLink6Description: https://datasheet.ciiva.com/16444/l0075s0083lqg15hs-16444389.pdf?src-supplier=Future+Electronics; LCSC Part Number: C86060
L27 L29 L30 L45 = LQG15HZ27NH02D: FIXED IND 27NH 350MA 460MOHM SMD; Manufacturer: Murata; Core Material: Air; Tolerance: 3%; Shielding: Unshielded; DC Resistance (DCR): 460mR; Self Resonant Frequency: 1.7GHz; Test Frequency: 100MHz; Item Type: Inductor; Supplier: Mouser; Supplier Part Number: 81-LQG15HZ27NH02D; Manufacturer Part Number: LQG15HZ27NH02D; RoHS: Yes; Category: Fixed Inductors; Stock: 436; Pricing: 1=0.1, 10=0.068, 50=0.068, 100=0.047, 1000=0.03, 10000=0.026 (USD); Mounting Technology: Surface Mount; Case/Package: 0402; Case Code (Imperial): 0402; Case Code (Metric): 1005; Min Operating Temperature: -55°C; Max Operating Temperature: 125°C; Packaging: Cut Tape; Value: 27nH; Current Rating: 350mA; Series: LQG15; Ratings: AEC-Q200; RoHS Compliant: Yes; ComponentLink1URL: http://search.murata.co.jp/Ceramy/image/img/P02/JELF243B-9110.pdf?src-supplier=Digi-Key; ComponentLink1Description: http://search.murata.co.jp/Ceramy/image/img/P02/JELF243B-9110.pdf?src-supplier=Digi-Key; LCSC Part Number: C237452
L28 = LQG15HS22NH02D: FIXED IND 22NH 350MA 420MOHM SMD / LQG15HS22NH02D; Manufacturer: Murata; Core Material: Air; Tolerance: 3%; Shielding: Unshielded; DC Resistance (DCR): 420mR; Self Resonant Frequency: 1.9GHz; Test Frequency: 100MHz; Item Type: Inductor; Supplier: Arrow Electronics; Supplier Part Number: LQG15HS22NH02D; Manufacturer Part Number: LQG15HS22NH02D; RoHS: Yes; Category: Fixed Inductors; Stock: 2924; Pricing: 1=0.0948, 10=0.044, 25=0.0437, 100=0.0323, 250=0.032, 500=0.0317, 1000=0.019 (USD); Mounting Technology: Surface Mount; Case/Package: 0402; Min Operating Temperature: -55°C; Max Operating Temperature: 125°C; Series: LQG15; Value: 22nH; RoHS Compliant: Yes; LCSC Part Number: C2041459
L31 L33-L35 = MHQ1005P12NGT000: FIXED IND 12NH 450MA 240MOHM SMD; Manufacturer: TDK; Item Type: Inductor; Supplier: Digikey; Supplier Part Number: 445-175572-1-ND; Manufacturer Part Number: MHQ1005P12NGT000; RoHS: Yes; Category: Fixed Inductors; Stock: 5317; Pricing: 1=0.18, 10=0.149, 25=0.1368, 50=0.1208, 100=0.1057, 250=0.10068, 500=0.09464, 1000=0.07249, 2500=0.06846 (USD); ComponentLink1URL: https://datasheet.ciiva.com/29693/inductor-commercial-high-frequency-mhq-en-29693630.pdf?src-supplier=Digikey; ComponentLink1Description: https://datasheet.ciiva.com/29693/inductor-commercial-high-frequency-mhq-en-29693630.pdf?src-supplier=Digikey; LCSC Part Number: C3911363
L43 = LQG15HS22NH02D: FIXED IND 22NH 350MA 420MOHM SMD; Manufacturer: Murata; Core Material: Air; Tolerance: 3%; Shielding: Unshielded; DC Resistance (DCR): 420mR; Self Resonant Frequency: 1.9GHz; Test Frequency: 100MHz; Item Type: Inductor; Supplier: Arrow Electronics; Supplier Part Number: LQG15HS22NH02D; Manufacturer Part Number: LQG15HS22NH02D; RoHS: Yes; Category: Fixed Inductors; Stock: 2924; Pricing: 1=0.0948, 10=0.044, 25=0.0437, 100=0.0323, 250=0.032, 500=0.0317, 1000=0.019 (USD); Mounting Technology: Surface Mount; Case/Package: 0402; Min Operating Temperature: -55°C; Max Operating Temperature: 125°C; Series: LQG15; Value: 22nH; RoHS Compliant: Yes; LCSC Part Number: C2041459
L44 = LQG15HS4N7S02D: FIXED IND 4.7NH 700MA 180MOHM SM; Manufacturer: Murata; Core Material: Air; Self Resonant Frequency: 6GHz; Q Factor: 8; Current Rating: 300mA; Shielding: Unshielded; DC Resistance (DCR): 180mR; Test Frequency: 100MHz; ESR: 160mR; Item Type: Inductor; Supplier: Avnet; Supplier Part Number: LQG15HS4N7S02D; Manufacturer Part Number: LQG15HS4N7S02D; RoHS: Yes; Category: Fixed Inductors; Stock: 30000; Pricing: 10000=0.02036, 20000=0.01989, 40000=0.01942 (USD); Mounting Technology: Surface Mount; Case/Package: 0402; Case Code (Metric): 1005; Case Code (Imperial): 0402; Min Operating Temperature: -55°C; Max Operating Temperature: 125°C; Package Quantity: 1; Packaging: Tape and Reel; Value: 4.7nH; Max DC Current: 300mA; Termination: SMD/SMT; DC Current: 300mA; Series: LQG15HS; Max Current Rating: 300mA; RMS Current (Irms): 700mA; Length: 1mm; Width: 0.02inch; Height: 0.5mm; Height - Seated (Max): 0.022inch; Depth: 0.55mm; Military Standard: Not; Lead Free: Lead Free; RoHS Compliant: Yes; ComponentLink1URL: https://datasheet.ciiva.com/11799/0900766b8090d685-11799034.pdf?src-supplier=Rs; ComponentLink1Description: https://datasheet.ciiva.com/11799/0900766b8090d685-11799034.pdf?src-supplier=Rs; ComponentLink2URL: https://datasheet.ciiva.com/1038/l0075s0083lqg15hs-1038121.pdf?src-supplier=Digikey; ComponentLink2Description: https://datasheet.ciiva.com/1038/l0075s0083lqg15hs-1038121.pdf?src-supplier=Digikey; ComponentLink3URL: https://datasheet.ciiva.com/1038/l0075s0083lqg15hs-1038123.pdf?src-supplier=Digikey; ComponentLink3Description: https://datasheet.ciiva.com/1038/l0075s0083lqg15hs-1038123.pdf?src-supplier=Digikey; ComponentLink4URL: https://datasheet.ciiva.com/8509/l0075s0083lqg15hs-8509718.pdf?src-supplier=Avnet; ComponentLink4Description: https://datasheet.ciiva.com/8509/l0075s0083lqg15hs-8509718.pdf?src-supplier=Avnet; ComponentLink5URL: https://datasheet.ciiva.com/1038/l0075s0083lqg15hs-1038122.pdf?src-supplier=Digikey; ComponentLink5Description: https://datasheet.ciiva.com/1038/l0075s0083lqg15hs-1038122.pdf?src-supplier=Digikey; LCSC Part Number: C86065
L46 = LQG15HS1N8S02D: FIXED IND 1.8NH 950MA 100MOHM SM; Manufacturer: Murata; Item Type: Inductor; Supplier: Arrow Electronics; Supplier Part Number: LQG15HS1N8S02D; Manufacturer Part Number: LQG15HS1N8S02D; RoHS: Yes; Category: Fixed Inductors; Stock: 78648; Pricing: 10000=0.0177, 50000=0.017 (USD); ComponentLink1URL: https://datasheet.ciiva.com/11801/0900766b80f10809-11801404.pdf?src-supplier=Rs; ComponentLink1Description: https://datasheet.ciiva.com/11801/0900766b80f10809-11801404.pdf?src-supplier=Rs; ComponentLink2URL: https://datasheet.ciiva.com/4977/o05e-4977799.pdf?src-supplier=Mouser; ComponentLink2Description: https://datasheet.ciiva.com/4977/o05e-4977799.pdf?src-supplier=Mouser; ComponentLink3URL: https://datasheet.ciiva.com/8510/l0075s0083lqg15hs-8510837.pdf?src-supplier=Avnet; ComponentLink3Description: https://datasheet.ciiva.com/8510/l0075s0083lqg15hs-8510837.pdf?src-supplier=Avnet; ComponentLink4URL: https://datasheet.ciiva.com/6690/l0075s0083lqg15hs-6690759.pdf?src-supplier=Digikey; ComponentLink4Description: https://datasheet.ciiva.com/6690/l0075s0083lqg15hs-6690759.pdf?src-supplier=Digikey; ComponentLink5URL: https://datasheet.ciiva.com/6690/l0075s0083lqg15hs-6690762.pdf?src-supplier=Digikey; ComponentLink5Description: https://datasheet.ciiva.com/6690/l0075s0083lqg15hs-6690762.pdf?src-supplier=Digikey; ComponentLink6URL: https://datasheet.ciiva.com/6690/l0075s0083lqg15hs-6690763.pdf?src-supplier=Digikey; ComponentLink6Description: https://datasheet.ciiva.com/6690/l0075s0083lqg15hs-6690763.pdf?src-supplier=Digikey; LCSC Part Number: C77107
R13 = RC0402FR-0756KL: RES 56K OHM 1% 1/16W 0402; Manufacturer: Yageo; Power Rating: 62.5mW; Temperature Coefficient: 100ppm/°C; Value: 56kR; Voltage Rating: 50V; Max Power Dissipation: 63mW; Item Type: Resistor; Supplier 1: Future Electronics; Manufacturer Part Number: RC0402FR-0756KL; RoHS: Yes; Category: Chip SMD Resistors; Stock 1: 2610000; Pricing 1: 10000=0.001, 50000=0.001, 300000=0.0009, 1000000=0.0009, 3000000=0.0008 (USD); Case/Package: 0402; Case Code (Metric): 1005; Case Code (Imperial): 0402; Min Operating Temperature: -55°C; Max Operating Temperature: 155°C; Tolerance: 1%; Series: RC; Technology: THICK FILM; Package Quantity: 1; Packaging: Tape and Reel; Resistor Type: Thick Film; Number of Terminations: 2; Termination: SMD/SMT; Working Voltage: 50V; Features: Moisture Resistant; Construction: Rectangular; Resistance Tolerance: 1%; Length: 0.039inch; Width: 0.02inch; Height: 0.016inch; Depth: 0.5mm; RoHS Compliant: Yes; Reach SVHC Compliant: No; Military Standard: Not; Lead Free: Lead Free; ComponentLink1URL: https://datasheet.ciiva.com/46412/1018594-46412840.pdf?src-supplier=Element14; ComponentLink1Description: https://datasheet.ciiva.com/46412/1018594-46412840.pdf?src-supplier=Element14; ComponentLink2URL: https://datasheet.ciiva.com/2453/pyu-r-int-thick-7-2453479.pdf?src-supplier=Digi-Key; ComponentLink2Description: https://datasheet.ciiva.com/2453/pyu-r-int-thick-7-2453479.pdf?src-supplier=Digi-Key; ComponentLink3URL: https://datasheet.ciiva.com/2453/pyu-r-int-thick-7-2453480.pdf?src-supplier=Digi-Key; ComponentLink3Description: https://datasheet.ciiva.com/2453/pyu-r-int-thick-7-2453480.pdf?src-supplier=Digi-Key; ComponentLink4URL: https://datasheet.ciiva.com/2453/pyu-r-int-thick-7-2453478.pdf?src-supplier=Digi-Key; ComponentLink4Description: https://datasheet.ciiva.com/2453/pyu-r-int-thick-7-2453478.pdf?src-supplier=Digi-Key; ComponentLink5URL: https://datasheet.ciiva.com/5558/pyu-rc0402-51-rohs-l-6-r-5558279.pdf?src-supplier=Mouser; ComponentLink5Description: https://datasheet.ciiva.com/5558/pyu-rc0402-51-rohs-l-6-r-5558279.pdf?src-supplier=Mouser; ComponentLink6URL: https://datasheet.ciiva.com/7850/1018594-7850045.pdf?src-supplier=Element14; ComponentLink6Description: https://datasheet.ciiva.com/7850/1018594-7850045.pdf?src-supplier=Element14; ComponentLink7URL: https://datasheet.ciiva.com/7850/1018594-7850044.pdf?src-supplier=Element14; ComponentLink7Description: https://datasheet.ciiva.com/7850/1018594-7850044.pdf?src-supplier=Element14; Supplier Part Number 1: 3873767; LCSC Part Number: C114756
U7 U9 = SKY13414-485LF: IC RF SWITCH SP4T 3GHZ 14QFN; Manufacturer: Skyworks Solutions; P1dB: 37dBm; Impedance: 50R; IIP3: 70dBm; Insertion Loss: 0.4dB; Test Frequency: 1GHz; Supplier: Digikey; Supplier Part Number: 863-1582-1-ND; Manufacturer Part Number: SKY13414-485LF; RoHS: Yes; Category: RF Semiconductors and Devices; Stock: 104074; Pricing: 1=1.36, 10=1.219, 25=1.1568, 100=0.9501, 250=0.88816, 500=0.78488, 1000=0.61964 (USD); Case/Package: QFN; Min Operating Temperature: -40°C; Max Operating Temperature: 85°C; Packaging: Tape and Reel; Package Quantity: 3000; Throw Configuration: SP4T; Series: -; RoHS Compliant: Yes; ComponentLink1URL: https://datasheet.ciiva.com/15309/sky13414-485lf-201689g-231640-15309794.pdf?src-supplier=Mouser; ComponentLink1Description: https://datasheet.ciiva.com/15309/sky13414-485lf-201689g-231640-15309794.pdf?src-supplier=Mouser; Item Type: IC
U8 = CC1101RGPR: IC RF TXRX ISM<1GHZ 20VFQFN; Manufacturer: Texas Instruments; Min Supply Voltage: 1.8V; Max Supply Voltage: 3.6V; Data Rate: 600Kbps; Frequency: 928MHz; Interface: SPI; Number of Receivers: 1; Sensitivity: -116dBm; Density: 0B; Current - Receiving: 17.1mA; Current - Transmitting: 34.2mA; Output Power (dBm): 12dBm; Supplier: Mouser; Supplier Part Number: 595-CC1101RGPR; Manufacturer Part Number: CC1101RGPR; RoHS: Yes; Category: RF Receivers, Transceivers; Stock: 8617; Pricing: 1=3.07, 10=2.76, 50=2.76, 100=2.26, 250=2.14, 500=1.92, 1000=1.62, 3000=1.54, 6000=1.48, 10000=1.54 (USD); Mounting Technology: Surface Mount; Case/Package: QFN; Pins: 20; Contact Plating: Gold; Weight: 0.002469oz; Min Operating Temperature: -40°C; Max Operating Temperature: 85°C; Packaging: Tape and Reel; Package Quantity: 3000; Number of Transmitters: 1; Clock Frequency: 928MHz; Series: -; Length: 4.15mm; Depth: 4.15mm; Reach SVHC Compliant: No; Lead Free: Lead Free; RoHS Compliant: Yes; ComponentLink1URL: https://datasheet.ciiva.com/15040/cc1101-15040501.pdf?src-supplier=Digi-Key; ComponentLink1Description: https://datasheet.ciiva.com/15040/cc1101-15040501.pdf?src-supplier=Digi-Key; ComponentLink2URL: https://datasheet.ciiva.com/15040/cc1101-15040502.pdf?src-supplier=Digi-Key; ComponentLink2Description: https://datasheet.ciiva.com/15040/cc1101-15040502.pdf?src-supplier=Digi-Key; LCSC Part Number: C29953; Item Type: IC
X6 = NX3225GA-26MHZ-EXS00A-CG01972: SMD3225-4P Crystals ROHS; Manufacturer: NDK; Manufacturer Part Number: NX3225GA-26MHZ-EXS00A-CG01972; Package: SMD3225-4P; LCSC Part Number: C485372; Item Type: Crystal; ComponentLink1Description: LCSC; ComponentLink1URL: https://www.lcsc.com/product-detail/Crystals_NDK-NX3225GA-26MHZ-EXS00A-CG01972_C485372.html